# Altium project MIDI Microtonal Keyboard.PrjPcb
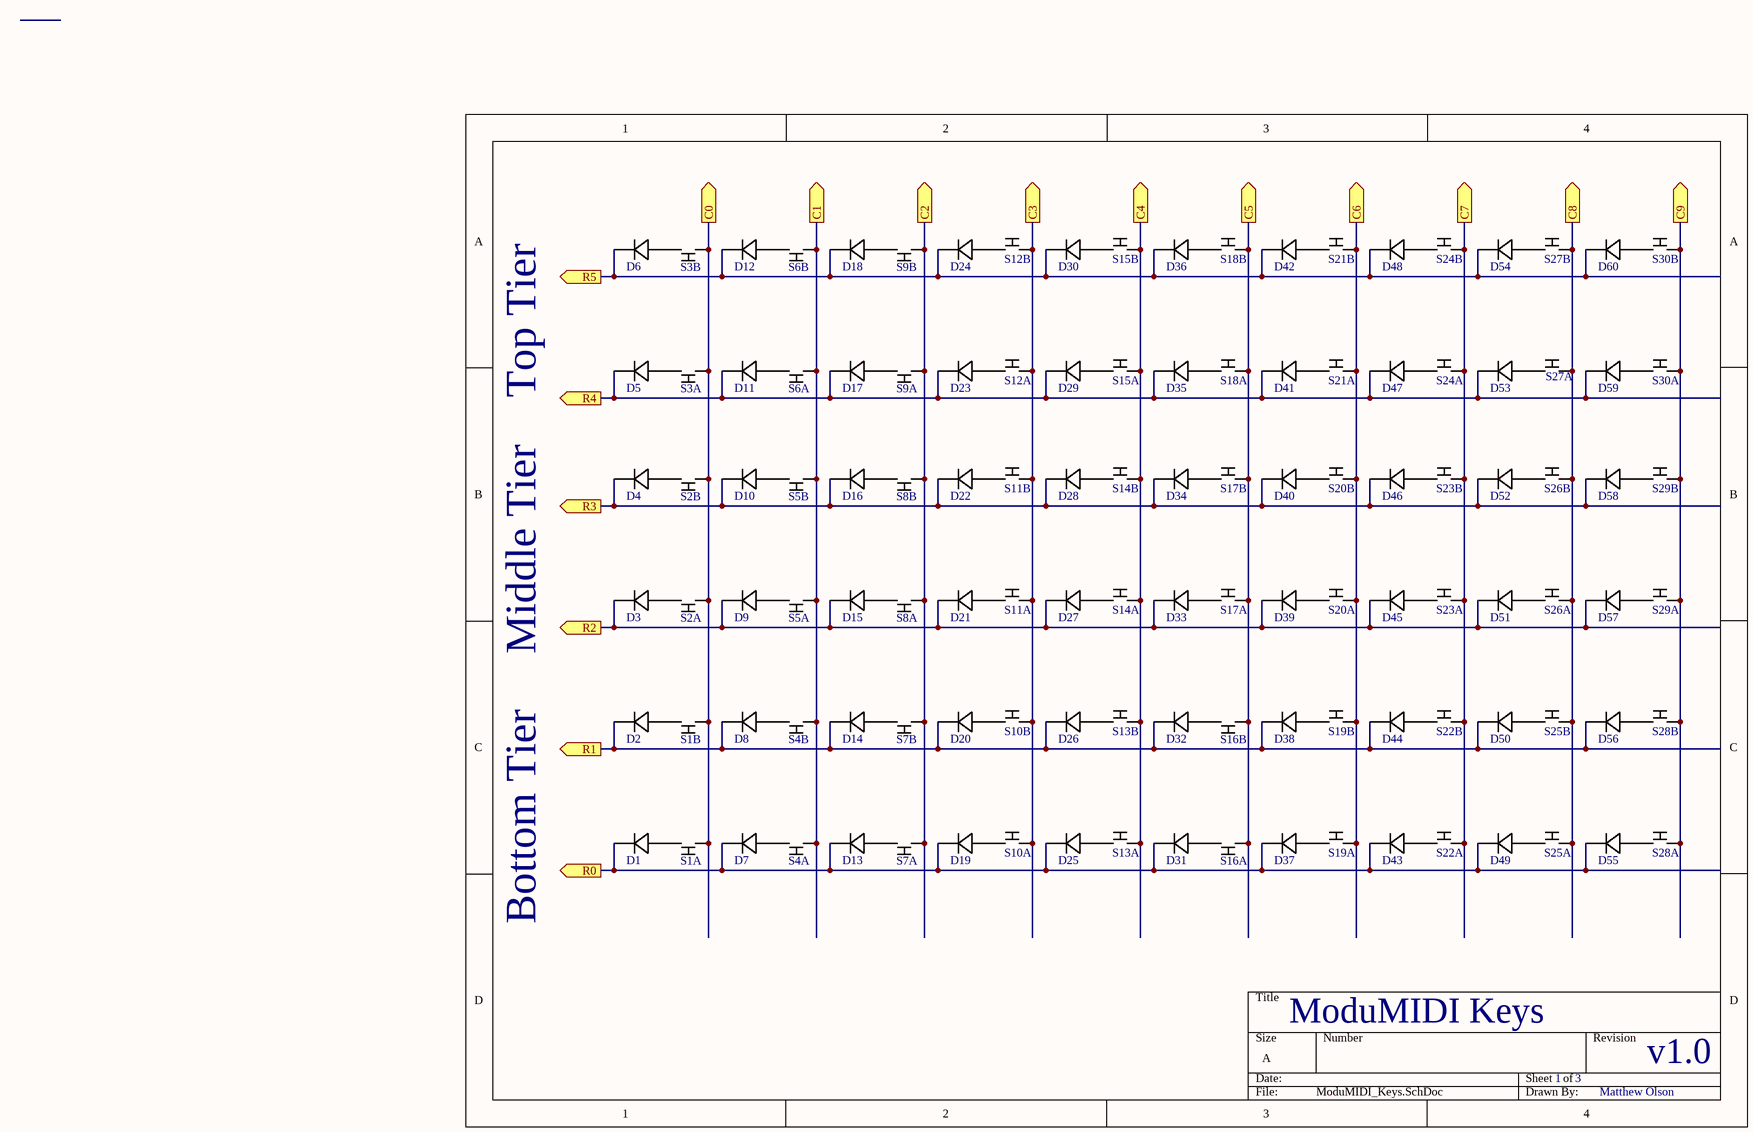
[diagram p0: ModuMIDI_Keys.SchDoc]
=title: ModuMIDI Keys
3 sheets, 162 parts. Net scope: global (net labels, ports and power ports of the same name join across sheets).
Board file: ModuMIDI.PcbDoc
Sheets:
  ModuMIDI_Keys.SchDoc
  ModuMIDI_LEDs.SchDoc
  ModuMIDI_Connectors_GPIO.SchDoc

## Sheet ModuMIDI_Keys.SchDoc
size A; SheetNumber: 1; SheetTotal: 3

### Parts
D1  1N4148-T26A  [DIODE_ZDO_DO-35_ONS]  (value not drawn)
D2  1N4148-T26A  [DIODE_ZDO_DO-35_ONS]  (value not drawn)
D3  1N4148-T26A  [DIODE_ZDO_DO-35_ONS]  (value not drawn)
D4  1N4148-T26A  [DIODE_ZDO_DO-35_ONS]  (value not drawn)
D5  1N4148-T26A  [DIODE_ZDO_DO-35_ONS]  (value not drawn)
D6  1N4148-T26A  [DIODE_ZDO_DO-35_ONS]  (value not drawn)
D7  1N4148-T26A  [DIODE_ZDO_DO-35_ONS]  (value not drawn)
D8  1N4148-T26A  [DIODE_ZDO_DO-35_ONS]  (value not drawn)
D9  1N4148-T26A  [DIODE_ZDO_DO-35_ONS]  (value not drawn)
D10  1N4148-T26A  [DIODE_ZDO_DO-35_ONS]  (value not drawn)
D11  1N4148-T26A  [DIODE_ZDO_DO-35_ONS]  (value not drawn)
D12  1N4148-T26A  [DIODE_ZDO_DO-35_ONS]  (value not drawn)
D13  1N4148-T26A  [DIODE_ZDO_DO-35_ONS]  (value not drawn)
D14  1N4148-T26A  [DIODE_ZDO_DO-35_ONS]  (value not drawn)
D15  1N4148-T26A  [DIODE_ZDO_DO-35_ONS]  (value not drawn)
D16  1N4148-T26A  [DIODE_ZDO_DO-35_ONS]  (value not drawn)
D17  1N4148-T26A  [DIODE_ZDO_DO-35_ONS]  (value not drawn)
D18  1N4148-T26A  [DIODE_ZDO_DO-35_ONS]  (value not drawn)
D19  1N4148-T26A  [DIODE_ZDO_DO-35_ONS]  (value not drawn)
D20  1N4148-T26A  [DIODE_ZDO_DO-35_ONS]  (value not drawn)
D21  1N4148-T26A  [DIODE_ZDO_DO-35_ONS]  (value not drawn)
D22  1N4148-T26A  [DIODE_ZDO_DO-35_ONS]  (value not drawn)
D23  1N4148-T26A  [DIODE_ZDO_DO-35_ONS]  (value not drawn)
D24  1N4148-T26A  [DIODE_ZDO_DO-35_ONS]  (value not drawn)
D25  1N4148-T26A  [DIODE_ZDO_DO-35_ONS]  (value not drawn)
D26  1N4148-T26A  [DIODE_ZDO_DO-35_ONS]  (value not drawn)
D27  1N4148-T26A  [DIODE_ZDO_DO-35_ONS]  (value not drawn)
D28  1N4148-T26A  [DIODE_ZDO_DO-35_ONS]  (value not drawn)
D29  1N4148-T26A  [DIODE_ZDO_DO-35_ONS]  (value not drawn)
D30  1N4148-T26A  [DIODE_ZDO_DO-35_ONS]  (value not drawn)
D31  1N4148-T26A  [DIODE_ZDO_DO-35_ONS]  (value not drawn)
D32  1N4148-T26A  [DIODE_ZDO_DO-35_ONS]  (value not drawn)
D33  1N4148-T26A  [DIODE_ZDO_DO-35_ONS]  (value not drawn)
D34  1N4148-T26A  [DIODE_ZDO_DO-35_ONS]  (value not drawn)
D35  1N4148-T26A  [DIODE_ZDO_DO-35_ONS]  (value not drawn)
D36  1N4148-T26A  [DIODE_ZDO_DO-35_ONS]  (value not drawn)
D37  1N4148-T26A  [DIODE_ZDO_DO-35_ONS]  (value not drawn)
D38  1N4148-T26A  [DIODE_ZDO_DO-35_ONS]  (value not drawn)
D39  1N4148-T26A  [DIODE_ZDO_DO-35_ONS]  (value not drawn)
D40  1N4148-T26A  [DIODE_ZDO_DO-35_ONS]  (value not drawn)
D41  1N4148-T26A  [DIODE_ZDO_DO-35_ONS]  (value not drawn)
D42  1N4148-T26A  [DIODE_ZDO_DO-35_ONS]  (value not drawn)
D43  1N4148-T26A  [DIODE_ZDO_DO-35_ONS]  (value not drawn)
D44  1N4148-T26A  [DIODE_ZDO_DO-35_ONS]  (value not drawn)
D45  1N4148-T26A  [DIODE_ZDO_DO-35_ONS]  (value not drawn)
D46  1N4148-T26A  [DIODE_ZDO_DO-35_ONS]  (value not drawn)
D47  1N4148-T26A  [DIODE_ZDO_DO-35_ONS]  (value not drawn)
D48  1N4148-T26A  [DIODE_ZDO_DO-35_ONS]  (value not drawn)
D49  1N4148-T26A  [DIODE_ZDO_DO-35_ONS]  (value not drawn)
D50  1N4148-T26A  [DIODE_ZDO_DO-35_ONS]  (value not drawn)
D51  1N4148-T26A  [DIODE_ZDO_DO-35_ONS]  (value not drawn)
D52  1N4148-T26A  [DIODE_ZDO_DO-35_ONS]  (value not drawn)
D53  1N4148-T26A  [DIODE_ZDO_DO-35_ONS]  (value not drawn)
D54  1N4148-T26A  [DIODE_ZDO_DO-35_ONS]  (value not drawn)
D55  1N4148-T26A  [DIODE_ZDO_DO-35_ONS]  (value not drawn)
D56  1N4148-T26A  [DIODE_ZDO_DO-35_ONS]  (value not drawn)
D57  1N4148-T26A  [DIODE_ZDO_DO-35_ONS]  (value not drawn)
D58  1N4148-T26A  [DIODE_ZDO_DO-35_ONS]  (value not drawn)
D59  1N4148-T26A  [DIODE_ZDO_DO-35_ONS]  (value not drawn)
D60  1N4148-T26A  [DIODE_ZDO_DO-35_ONS]  (value not drawn)
S1  Button_Symbol  [ModuMIDI_Button_Footprint]  (value not drawn)  (parts A,B of 2)
S2  Button_Symbol  [ModuMIDI_Button_Footprint]  (value not drawn)  (parts A,B of 2)
S3  Button_Symbol  [ModuMIDI_Button_Footprint]  (value not drawn)  (parts A,B of 2)
S4  Button_Symbol  [ModuMIDI_Button_Footprint]  (value not drawn)  (parts A,B of 2)
S5  Button_Symbol  [ModuMIDI_Button_Footprint]  (value not drawn)  (parts A,B of 2)
S6  Button_Symbol  [ModuMIDI_Button_Footprint]  (value not drawn)  (parts A,B of 2)
S7  Button_Symbol  [ModuMIDI_Button_Footprint]  (value not drawn)  (parts A,B of 2)
S8  Button_Symbol  [ModuMIDI_Button_Footprint]  (value not drawn)  (parts A,B of 2)
S9  Button_Symbol  [ModuMIDI_Button_Footprint]  (value not drawn)  (parts A,B of 2)
S10  Button_Symbol  [ModuMIDI_Button_Footprint]  (value not drawn)  (parts A,B of 2)
S11  Button_Symbol  [ModuMIDI_Button_Footprint]  (value not drawn)  (parts A,B of 2)
S12  Button_Symbol  [ModuMIDI_Button_Footprint]  (value not drawn)  (parts A,B of 2)
S13  Button_Symbol  [ModuMIDI_Button_Footprint]  (value not drawn)  (parts A,B of 2)
S14  Button_Symbol  [ModuMIDI_Button_Footprint]  (value not drawn)  (parts A,B of 2)
S15  Button_Symbol  [ModuMIDI_Button_Footprint]  (value not drawn)  (parts A,B of 2)
S16  Button_Symbol  [ModuMIDI_Button_Footprint]  (value not drawn)  (parts A,B of 2)
S17  Button_Symbol  [ModuMIDI_Button_Footprint]  (value not drawn)  (parts A,B of 2)
S18  Button_Symbol  [ModuMIDI_Button_Footprint]  (value not drawn)  (parts A,B of 2)
S19  Button_Symbol  [ModuMIDI_Button_Footprint]  (value not drawn)  (parts A,B of 2)
S20  Button_Symbol  [ModuMIDI_Button_Footprint]  (value not drawn)  (parts A,B of 2)
S21  Button_Symbol  [ModuMIDI_Button_Footprint]  (value not drawn)  (parts A,B of 2)
S22  Button_Symbol  [ModuMIDI_Button_Footprint]  (value not drawn)  (parts A,B of 2)
S23  Button_Symbol  [ModuMIDI_Button_Footprint]  (value not drawn)  (parts A,B of 2)
S24  Button_Symbol  [ModuMIDI_Button_Footprint]  (value not drawn)  (parts A,B of 2)
S25  Button_Symbol  [ModuMIDI_Button_Footprint]  (value not drawn)  (parts A,B of 2)
S26  Button_Symbol  [ModuMIDI_Button_Footprint]  (value not drawn)  (parts A,B of 2)
S27  Button_Symbol  [ModuMIDI_Button_Footprint]  (value not drawn)  (parts A,B of 2)
S28  Button_Symbol  [ModuMIDI_Button_Footprint]  (value not drawn)  (parts A,B of 2)
S29  Button_Symbol  [ModuMIDI_Button_Footprint]  (value not drawn)  (parts A,B of 2)
S30  Button_Symbol  [ModuMIDI_Button_Footprint]  (value not drawn)  (parts A,B of 2)

### Ports
C0 (out), C1 (out), C2 (out), C3 (out), C4 (out), C5 (out), C6 (out), C7 (out), C8 (out), C9 (out), R0 (out), R1 (out), R2 (out), R3 (out), R4 (out), R5 (out)

### Nets
C0: S1.1 S1.3 S2.1 S2.3 S3.1 S3.3 ; port C0
C1: S4.1 S4.3 S5.1 S5.3 S6.1 S6.3 ; port C1
C2: S7.1 S7.3 S8.1 S8.3 S9.1 S9.3 ; port C2
C3: S10.1 S10.3 S11.1 S11.3 S12.1 S12.3 ; port C3
C4: S13.1 S13.3 S14.1 S14.3 S15.1 S15.3 ; port C4
C5: S16.1 S16.3 S17.1 S17.3 S18.1 S18.3 ; port C5
C6: S19.1 S19.3 S20.1 S20.3 S21.1 S21.3 ; port C6
C7: S22.1 S22.3 S23.1 S23.3 S24.1 S24.3 ; port C7
C8: S25.1 S25.3 S26.1 S26.3 S27.1 S27.3 ; port C8
C9: S28.1 S28.3 S29.1 S29.3 S30.1 S30.3 ; port C9
R0: D1.1 D7.1 D13.1 D19.1 D25.1 D31.1 D37.1 D43.1 D49.1 D55.1 ; port R0
R1: D2.1 D8.1 D14.1 D20.1 D26.1 D32.1 D38.1 D44.1 D50.1 D56.1 ; port R1
R2: D3.1 D9.1 D15.1 D21.1 D27.1 D33.1 D39.1 D45.1 D51.1 D57.1 ; port R2
R3: D4.1 D10.1 D16.1 D22.1 D28.1 D34.1 D40.1 D46.1 D52.1 D58.1 ; port R3
R4: D5.1 D11.1 D17.1 D23.1 D29.1 D35.1 D41.1 D47.1 D53.1 D59.1 ; port R4
R5: D6.1 D12.1 D18.1 D24.1 D30.1 D36.1 D42.1 D48.1 D54.1 D60.1 ; port R5
NetD1_2: D1.2 S1.0
NetD2_2: D2.2 S1.2
NetD3_2: D3.2 S2.0
NetD4_2: D4.2 S2.2
NetD5_2: D5.2 S3.0
NetD6_2: D6.2 S3.2
NetD7_2: D7.2 S4.0
NetD8_2: D8.2 S4.2
NetD9_2: D9.2 S5.0
NetD10_2: D10.2 S5.2
NetD11_2: D11.2 S6.0
NetD12_2: D12.2 S6.2
NetD13_2: D13.2 S7.0
NetD14_2: D14.2 S7.2
NetD15_2: D15.2 S8.0
NetD16_2: D16.2 S8.2
NetD17_2: D17.2 S9.0
NetD18_2: D18.2 S9.2
NetD19_2: D19.2 S10.0
NetD20_2: D20.2 S10.2
NetD21_2: D21.2 S11.0
NetD22_2: D22.2 S11.2
NetD23_2: D23.2 S12.0
NetD24_2: D24.2 S12.2
NetD25_2: D25.2 S13.0
NetD26_2: D26.2 S13.2
NetD27_2: D27.2 S14.0
NetD28_2: D28.2 S14.2
NetD29_2: D29.2 S15.0
NetD30_2: D30.2 S15.2
NetD31_2: D31.2 S16.0
NetD32_2: D32.2 S16.2
NetD33_2: D33.2 S17.0
NetD34_2: D34.2 S17.2
NetD35_2: D35.2 S18.0
NetD36_2: D36.2 S18.2
NetD37_2: D37.2 S19.0
NetD38_2: D38.2 S19.2
NetD39_2: D39.2 S20.0
NetD40_2: D40.2 S20.2
NetD41_2: D41.2 S21.0
NetD42_2: D42.2 S21.2
NetD43_2: D43.2 S22.0
NetD44_2: D44.2 S22.2
NetD45_2: D45.2 S23.0
NetD46_2: D46.2 S23.2
NetD47_2: D47.2 S24.0
NetD48_2: D48.2 S24.2
NetD49_2: D49.2 S25.0
NetD50_2: D50.2 S25.2
NetD51_2: D51.2 S26.0
NetD52_2: D52.2 S26.2
NetD53_2: D53.2 S27.0
NetD54_2: D54.2 S27.2
NetD55_2: D55.2 S28.0
NetD56_2: D56.2 S28.2
NetD57_2: D57.2 S29.0
NetD58_2: D58.2 S29.2
NetD59_2: D59.2 S30.0
NetD60_2: D60.2 S30.2

### Notes on the sheet
- Top Tier
- Middle Tier
- Bottom Tier
- ModuMIDI Keys
- 1
- 3
- v1.0
- Matthew Olson

### Library data of the parts
D1-D60 = 1N4148-T26A: DIODE GEN PURP 100V 200MA DO35; Mfr_Name: onsemi; Type: DEV; Copyright: Copyright (C) 2023 Ultra Librarian. All rights reserved.; PN: 1N4148-T26A; RefDes: RefDes
S1-S30 = Button_Symbol: Two button switches to match silicon buttons for keyboard

## Sheet ModuMIDI_LEDs.SchDoc
size A; SheetNumber: 2; SheetTotal: 3
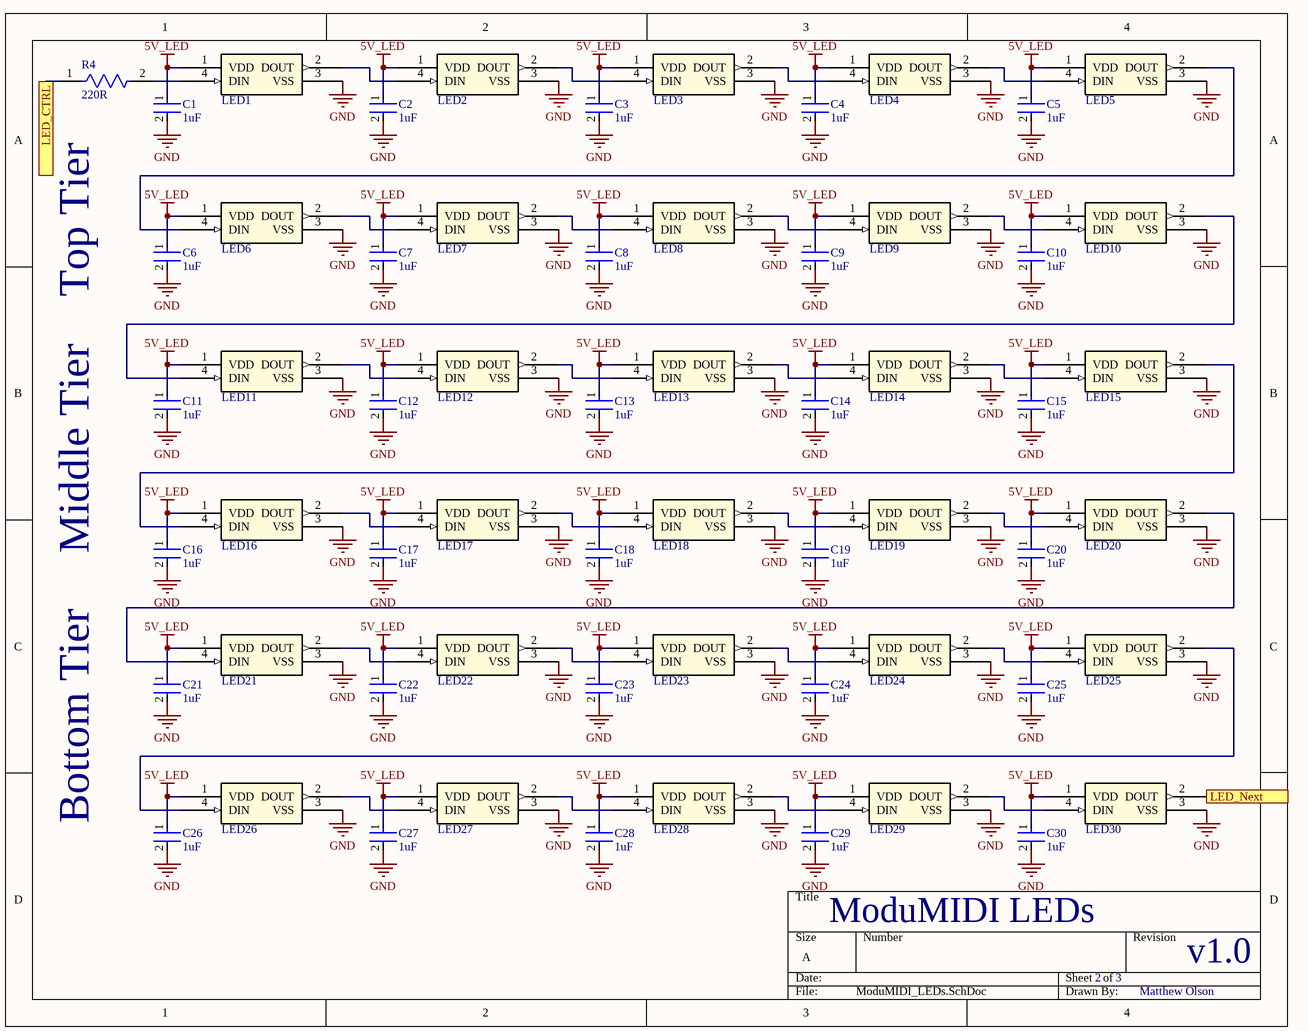
[diagram p1: ModuMIDI_LEDs.SchDoc]

### Parts
C1  1uF  [FP-CC0805-0_85-MFG]
C2  1uF  [FP-CC0805-0_85-MFG]
C3  1uF  [FP-CC0805-0_85-MFG]
C4  1uF  [FP-CC0805-0_85-MFG]
C5  1uF  [FP-CC0805-0_85-MFG]
C6  1uF  [FP-CC0805-0_85-MFG]
C7  1uF  [FP-CC0805-0_85-MFG]
C8  1uF  [FP-CC0805-0_85-MFG]
C9  1uF  [FP-CC0805-0_85-MFG]
C10  1uF  [FP-CC0805-0_85-MFG]
C11  1uF  [FP-CC0805-0_85-MFG]
C12  1uF  [FP-CC0805-0_85-MFG]
C13  1uF  [FP-CC0805-0_85-MFG]
C14  1uF  [FP-CC0805-0_85-MFG]
C15  1uF  [FP-CC0805-0_85-MFG]
C16  1uF  [FP-CC0805-0_85-MFG]
C17  1uF  [FP-CC0805-0_85-MFG]
C18  1uF  [FP-CC0805-0_85-MFG]
C19  1uF  [FP-CC0805-0_85-MFG]
C20  1uF  [FP-CC0805-0_85-MFG]
C21  1uF  [FP-CC0805-0_85-MFG]
C22  1uF  [FP-CC0805-0_85-MFG]
C23  1uF  [FP-CC0805-0_85-MFG]
C24  1uF  [FP-CC0805-0_85-MFG]
C25  1uF  [FP-CC0805-0_85-MFG]
C26  1uF  [FP-CC0805-0_85-MFG]
C27  1uF  [FP-CC0805-0_85-MFG]
C28  1uF  [FP-CC0805-0_85-MFG]
C29  1uF  [FP-CC0805-0_85-MFG]
C30  1uF  [FP-CC0805-0_85-MFG]
LED1  IN-PI55TATPRPGPB  [LED_IN-PI55TAT_INL]  (value not drawn)
LED2  IN-PI55TATPRPGPB  [LED_IN-PI55TAT_INL]  (value not drawn)
LED3  IN-PI55TATPRPGPB  [LED_IN-PI55TAT_INL]  (value not drawn)
LED4  IN-PI55TATPRPGPB  [LED_IN-PI55TAT_INL]  (value not drawn)
LED5  IN-PI55TATPRPGPB  [LED_IN-PI55TAT_INL]  (value not drawn)
LED6  IN-PI55TATPRPGPB  [LED_IN-PI55TAT_INL]  (value not drawn)
LED7  IN-PI55TATPRPGPB  [LED_IN-PI55TAT_INL]  (value not drawn)
LED8  IN-PI55TATPRPGPB  [LED_IN-PI55TAT_INL]  (value not drawn)
LED9  IN-PI55TATPRPGPB  [LED_IN-PI55TAT_INL]  (value not drawn)
LED10  IN-PI55TATPRPGPB  [LED_IN-PI55TAT_INL]  (value not drawn)
LED11  IN-PI55TATPRPGPB  [LED_IN-PI55TAT_INL]  (value not drawn)
LED12  IN-PI55TATPRPGPB  [LED_IN-PI55TAT_INL]  (value not drawn)
LED13  IN-PI55TATPRPGPB  [LED_IN-PI55TAT_INL]  (value not drawn)
LED14  IN-PI55TATPRPGPB  [LED_IN-PI55TAT_INL]  (value not drawn)
LED15  IN-PI55TATPRPGPB  [LED_IN-PI55TAT_INL]  (value not drawn)
LED16  IN-PI55TATPRPGPB  [LED_IN-PI55TAT_INL]  (value not drawn)
LED17  IN-PI55TATPRPGPB  [LED_IN-PI55TAT_INL]  (value not drawn)
LED18  IN-PI55TATPRPGPB  [LED_IN-PI55TAT_INL]  (value not drawn)
LED19  IN-PI55TATPRPGPB  [LED_IN-PI55TAT_INL]  (value not drawn)
LED20  IN-PI55TATPRPGPB  [LED_IN-PI55TAT_INL]  (value not drawn)
LED21  IN-PI55TATPRPGPB  [LED_IN-PI55TAT_INL]  (value not drawn)
LED22  IN-PI55TATPRPGPB  [LED_IN-PI55TAT_INL]  (value not drawn)
LED23  IN-PI55TATPRPGPB  [LED_IN-PI55TAT_INL]  (value not drawn)
LED24  IN-PI55TATPRPGPB  [LED_IN-PI55TAT_INL]  (value not drawn)
LED25  IN-PI55TATPRPGPB  [LED_IN-PI55TAT_INL]  (value not drawn)
LED26  IN-PI55TATPRPGPB  [LED_IN-PI55TAT_INL]  (value not drawn)
LED27  IN-PI55TATPRPGPB  [LED_IN-PI55TAT_INL]  (value not drawn)
LED28  IN-PI55TATPRPGPB  [LED_IN-PI55TAT_INL]  (value not drawn)
LED29  IN-PI55TATPRPGPB  [LED_IN-PI55TAT_INL]  (value not drawn)
LED30  IN-PI55TATPRPGPB  [LED_IN-PI55TAT_INL]  (value not drawn)
R4  220R  [FP-CRCW0805-e3-MFG]

### Ports
LED_CTRL, LED_Next (out)

### Nets
5V_LED: C1.1 C2.1 C3.1 C4.1 C5.1 C6.1 C7.1 C8.1 C9.1 C10.1 C11.1 C12.1 C13.1 C14.1 C15.1 C16.1 C17.1 C18.1 C19.1 C20.1 C21.1 C22.1 C23.1 C24.1 C25.1 C26.1 C27.1 C28.1 C29.1 C30.1 LED1.1(VDD) LED2.1(VDD) LED3.1(VDD) LED4.1(VDD) LED5.1(VDD) LED6.1(VDD) LED7.1(VDD) LED8.1(VDD) LED9.1(VDD) LED10.1(VDD) LED11.1(VDD) LED12.1(VDD) LED13.1(VDD) LED14.1(VDD) LED15.1(VDD) LED16.1(VDD) LED17.1(VDD) LED18.1(VDD) LED19.1(VDD) LED20.1(VDD) LED21.1(VDD) LED22.1(VDD) LED23.1(VDD) LED24.1(VDD) LED25.1(VDD) LED26.1(VDD) LED27.1(VDD) LED28.1(VDD) LED29.1(VDD) LED30.1(VDD)
GND: C1.2 C2.2 C3.2 C4.2 C5.2 C6.2 C7.2 C8.2 C9.2 C10.2 C11.2 C12.2 C13.2 C14.2 C15.2 C16.2 C17.2 C18.2 C19.2 C20.2 C21.2 C22.2 C23.2 C24.2 C25.2 C26.2 C27.2 C28.2 C29.2 C30.2 LED1.3(VSS) LED2.3(VSS) LED3.3(VSS) LED4.3(VSS) LED5.3(VSS) LED6.3(VSS) LED7.3(VSS) LED8.3(VSS) LED9.3(VSS) LED10.3(VSS) LED11.3(VSS) LED12.3(VSS) LED13.3(VSS) LED14.3(VSS) LED15.3(VSS) LED16.3(VSS) LED17.3(VSS) LED18.3(VSS) LED19.3(VSS) LED20.3(VSS) LED21.3(VSS) LED22.3(VSS) LED23.3(VSS) LED24.3(VSS) LED25.3(VSS) LED26.3(VSS) LED27.3(VSS) LED28.3(VSS) LED29.3(VSS) LED30.3(VSS)
LED_CTRL: R4.1 ; port LED_CTRL
LED_Next: LED30.2(DOUT) ; port LED_Next
NetLED1_2: LED1.2(DOUT) LED2.4(DIN)
NetLED1_4: LED1.4(DIN) R4.2
NetLED2_2: LED2.2(DOUT) LED3.4(DIN)
NetLED3_2: LED3.2(DOUT) LED4.4(DIN)
NetLED4_2: LED4.2(DOUT) LED5.4(DIN)
NetLED5_2: LED5.2(DOUT) LED6.4(DIN)
NetLED6_2: LED6.2(DOUT) LED7.4(DIN)
NetLED7_2: LED7.2(DOUT) LED8.4(DIN)
NetLED8_2: LED8.2(DOUT) LED9.4(DIN)
NetLED9_2: LED9.2(DOUT) LED10.4(DIN)
NetLED10_2: LED10.2(DOUT) LED11.4(DIN)
NetLED11_2: LED11.2(DOUT) LED12.4(DIN)
NetLED12_2: LED12.2(DOUT) LED13.4(DIN)
NetLED13_2: LED13.2(DOUT) LED14.4(DIN)
NetLED14_2: LED14.2(DOUT) LED15.4(DIN)
NetLED15_2: LED15.2(DOUT) LED16.4(DIN)
NetLED16_2: LED16.2(DOUT) LED17.4(DIN)
NetLED17_2: LED17.2(DOUT) LED18.4(DIN)
NetLED18_2: LED18.2(DOUT) LED19.4(DIN)
NetLED19_2: LED19.2(DOUT) LED20.4(DIN)
NetLED20_2: LED20.2(DOUT) LED21.4(DIN)
NetLED21_2: LED21.2(DOUT) LED22.4(DIN)
NetLED22_2: LED22.2(DOUT) LED23.4(DIN)
NetLED23_2: LED23.2(DOUT) LED24.4(DIN)
NetLED24_2: LED24.2(DOUT) LED25.4(DIN)
NetLED25_2: LED25.2(DOUT) LED26.4(DIN)
NetLED26_2: LED26.2(DOUT) LED27.4(DIN)
NetLED27_2: LED27.2(DOUT) LED28.4(DIN)
NetLED28_2: LED28.2(DOUT) LED29.4(DIN)
NetLED29_2: LED29.2(DOUT) LED30.4(DIN)

### Notes on the sheet
- (near R4) Top Tier
- Middle Tier
- Bottom Tier
- ModuMIDI LEDs
- 2
- 3
- v1.0
- Matthew Olson

### Library data of the parts
C1-C30 = CMP-03422-000182-1: CAP CER 1UF 10V X7R 0805; Manufacturer: Yageo; Manufacturer Part Number: CC0805KKX7R6BB105; Material: Ceramic; Tolerance: 0.1; Value: 1 uF; ComponentLink2URL: http://www.yageo.com/documents/recent/UPY-GPHC_Y5V_6.3V-to-50V_8.pdf; Automotive: No; Temperature Range Low: -30°C; Octopart: https://octopart.com/cc0805kkx7r6bb105-yageo-42522859; Temperature Characteristic: X7R; RoHS: TRUE; Voltage Rating: 10 V; Capacitance: 1 uF; Package: CC0805-0.85; Device Class L3: Ceramic Capacitors; Category: Cap; Mouser Description: Multilayer Ceramic Capacitors MLCC - SMD/SMT 1.0uF 10V X7R 10%; Temperature Range High: +85°C; Ipc Land Pattern Name: CAPC200125X85; ComponentLink2Description: Datasheet; Temperature: -30°C to +85°C; Height: 0.95mm; Lead Free: Yes; Device Class L1: Passive Components; Device Class L2: Capacitors; Footprint Url: http://www.yageo.com/exep/pages/download/literatures/UPY-C_GEN_24.pdf; Digikey Description: CAP CER 1UF 10V X7R 0805; PN: CC0805KKX7R6BB105
LED1-LED30 = IN-PI55TATPRPGPB: No Description Available; Mfr_Name: Inolux; RefDes: RefDes; Type: Type; PN: IN-PI55TATPRPGPB
R4 = CMP-2001-03682-2: RES Thick Film, 220Ω, 1%, 0.125W, 100ppm/°C, 0805; Max Power Dissipation: 125mW; Voltage Rating: 150V; PN: CRCW0805220RFKEA; Packaging: Tape and Reel; Termination: SMD/SMT; Height: 0.45mm; Package Quantity: 10; Width: 0.049inch; Min Operating Temperature: -55°C; Lead Free: Lead Free; Military Standard: Not; Mount: Surface Mount; Max Operating Temperature: 155°C; Voltage Rating (DC): 150V; Resistance: 220R; Composition: Thick Film; Case/Package: 0805; Length: 2mm; Weight: 0.000194oz; Case Code (Metric): 2012; Number of Terminations: 2; Case Code (Imperial): 0805; Radiation Hardening: No; Tolerance: 1%; Features: Automotive AEC-Q200; Power Rating: 125mW; Depth: 1.25mm; Contact Plating: Tin; Temperature Coefficient: 100ppm/°C

## Sheet ModuMIDI_Connectors_GPIO.SchDoc
size A; SheetNumber: 3; SheetTotal: 3
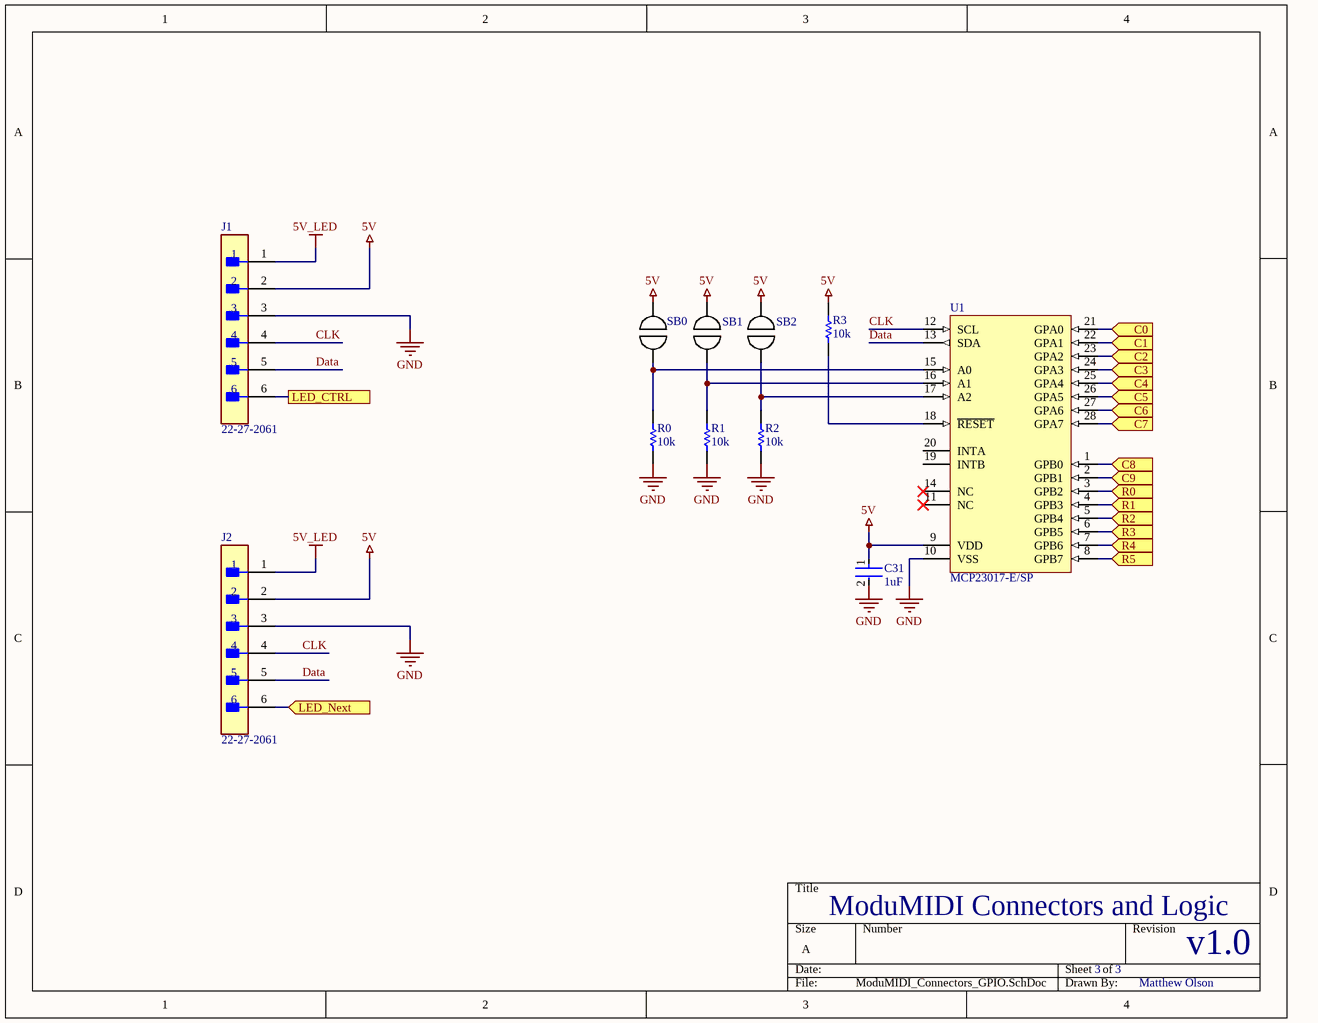
[diagram p2: ModuMIDI_Connectors_GPIO.SchDoc]

### Parts
C31  1uF  [FP-CC0805-0_85-MFG]
J1  22-27-2061  [FP-22-27-2061-MFG]
J2  22-27-2061  [FP-22-27-2061-MFG]
R0  10k  [RESC2013X60X35NL10T20]
R1  10k  [RESC2013X60X35NL10T20]
R2  10k  [RESC2013X60X35NL10T20]
R3  10k  [RESC2013X60X35NL10T20]
SB0  Solder_Bridge_Open  [PCBComponent_1]  (value not drawn)  (net tie, no BOM)
SB1  Solder_Bridge_Open  [PCBComponent_1]  (value not drawn)  (net tie, no BOM)
SB2  Solder_Bridge_Open  [PCBComponent_1]  (value not drawn)  (net tie, no BOM)
U1  MCP23017-E/SP  [SPDIP300-SP28]

### Ports
C0 (in), C1 (in), C2 (in), C3 (in), C4 (in), C5 (in), C6 (in), C7 (in), C8 (in), C9 (in), LED_CTRL, LED_Next (in), R0 (in), R1 (in), R2 (in), R3 (in), R4 (in), R5 (in)

### Nets
5V: C31.1 J1.2 J2.2 R3.2 SB0.2 SB1.2 SB2.2 U1.9(VDD)
5V_LED: J1.1 J2.1
GND: C31.2 J1.3 J2.3 R0.1 R1.1 R2.1 U1.10(VSS)
C0: U1.21(GPA0) ; port C0
C1: U1.22(GPA1) ; port C1
C2: U1.23(GPA2) ; port C2
C3: U1.24(GPA3) ; port C3
C4: U1.25(GPA4) ; port C4
C5: U1.26(GPA5) ; port C5
C6: U1.27(GPA6) ; port C6
C7: U1.28(GPA7) ; port C7
C8: U1.1(GPB0) ; port C8
C9: U1.2(GPB1) ; port C9
CLK: J1.4 J2.4 U1.12(SCL)
Data: J1.5 J2.5 U1.13(SDA)
LED_CTRL: J1.6 ; port LED_CTRL
LED_Next: J2.6 ; port LED_Next
R0: U1.3(GPB2) ; port R0
R1: U1.4(GPB3) ; port R1
R2: U1.5(GPB4) ; port R2
R3: U1.6(GPB5) ; port R3
R4: U1.7(GPB6) ; port R4
R5: U1.8(GPB7) ; port R5
NetR0_2: R0.2 SB0.1 U1.15(A0)
NetR1_2: R1.2 SB1.1 U1.16(A1)
NetR2_2: R2.2 SB2.1 U1.17(A2)
NetR3_1: R3.1 U1.18(~{RESET})

Not connected (* = marked no-connect by the designer): U1 11(NC)* 14(NC)* 19(INTB) 20(INTA)

### Notes on the sheet
- ModuMIDI Connectors and Logic
- 3
- v1.0
- Matthew Olson

### Library data of the parts
C31 = CMP-03422-000182-1: as C1 on sheet ModuMIDI_LEDs; Value: 1 uF; ComponentLink2URL: http://www.yageo.com/documents/recent/UPY-GPHC_Y5V_6.3V-to-50V_8.pdf; Automotive: No; Temperature Range Low: -30°C; Octopart: https://octopart.com/cc0805kkx7r6bb105-yageo-42522859; Temperature Characteristic: X7R; RoHS: TRUE; Voltage Rating: 10 V; Capacitance: 1 uF; Package: CC0805-0.85; Device Class L3: Ceramic Capacitors; Category: Cap; Mouser Description: Multilayer Ceramic Capacitors MLCC - SMD/SMT 1.0uF 10V X7R 10%; Temperature Range High: +85°C; Ipc Land Pattern Name: CAPC200125X85; ComponentLink2Description: Datasheet; Temperature: -30°C to +85°C; Height: 0.95mm; Lead Free: Yes; Device Class L1: Passive Components; Device Class L2: Capacitors; Footprint Url: http://www.yageo.com/exep/pages/download/literatures/UPY-C_GEN_24.pdf; Digikey Description: CAP CER 1UF 10V X7R 0805; PN: CC0805KKX7R6BB105
J1 J2 = CMP-04776-000309-1: CONN HEADER VERT 6POS 2.54MM; Number of Contacts: 6; Current Rating: 4A; Voltage Rating (AC): 250V; Contact Resistance: 10mR; Hole Diameter: 1.02mm; Connector Type: Male Pin; Gender: Male; Mount: Through Hole; REACH SVHC: No SVHC; Number of Rows: 1; Contact Plating: Tin; Series: KK; Depth: 5.8mm; Flammability Rating: UL94 V-0; Contact Type: Male Pin; Lead Pitch: 2.54mm; Min Operating Temperature: 0°C; Pitch: 2.54mm; Radiation Hardening: No; Color: Natural; Length: 15.24mm; Termination: Solder; Orientation: Straight; Contact Material: Brass; Max Voltage Rating (AC): 250V; Housing Material: Nylon; Max Operating Temperature: 75°C; Working Voltage: 250V; Max Current Rating: 4A; Fastening Type: Friction; Voltage Rating: 250V; Housing Color: White; Packaging: Bulk; Material: Nylon; Contact Mating Length: 0.295inch; Package Quantity: 10000; Number of Positions: 6
R0-R3 = CMP-1659-00013-4: Chip Resistor, 10 KOhm, +/- 1%, 0.125 W, -55 to 155 degC, 0805 (2012 Metric), RoHS, Tape and Reel / RC0805FR-0710KL; Manufacturer: Yageo; Voltage Rating: 150 V; Mount: Surface Mount; ComponentLink1Description: Manufacturer URL; ComponentLink2URL: http://www.yageo.com/documents/recent/PYu-RC_Group_51_RoHS_L_04.pdf; Pins: 2; Length: 2 mm; Min Operating Temperature: -55 degC; Height: 0.5 mm; Mounting Technology: Surface Mount; RoHSCompliant: true; REACH SVHC: No SVHC; ComponentLink1URL: http://www.yageo.com/; Max Operating Temperature: 155 degC; PackageReference: 0805; DatasheetVersion: Rev. 4, 02/2016; Package Quantity: 5000; Packaging: Tape and Reel; ComponentLink2Description: Datasheet; PackageDescription: 2-Pin Surface Mounted Device, Body 2 x 1.25 mm; PN: RC0805FR-0710KL
SB0-SB2 = Solder_Bridge_Open: Normally open solder bridge
U1 = CMP-0186-00081-2: 16-Bit I/O Expander with Serial Interface, 28-Pin SPDIP, Extended Temperature; RevisionNote: URLs added.; ComponentLink3Description: Package Specification; PackageVersion: revBB, Aug-2009; ComponentLink1Description: Manufacturer URL; DatasheetVersion: revB, Feb-2007; PackageDescription: 28-Lead Skinny Plastic Dual In-Line (SP) - 300 mil Body [SPDIP]; ComponentLink1URL: http://www.microchip.com/; PackageReference: SPDIP300-SP28; ComponentLink3URL: http://www.microchip.com/stellent/groups/techpub_sg/documents/packagingspec/en012702.pdf; ComponentLink2Description: Datasheet; ComponentLink2URL: http://ww1.microchip.com/downloads/en/DeviceDoc/21952b.pdf

## Nets that join several sheets
5V_LED: ModuMIDI_LEDs (60 pins), ModuMIDI_Connectors_GPIO (J1.1 J2.1)
GND: ModuMIDI_LEDs (60 pins), ModuMIDI_Connectors_GPIO (7 pins)
C0: ModuMIDI_Keys (6 pins), ModuMIDI_Connectors_GPIO (U1.21)
C1: ModuMIDI_Keys (6 pins), ModuMIDI_Connectors_GPIO (U1.22)
C2: ModuMIDI_Keys (6 pins), ModuMIDI_Connectors_GPIO (U1.23)
C3: ModuMIDI_Keys (6 pins), ModuMIDI_Connectors_GPIO (U1.24)
C4: ModuMIDI_Keys (6 pins), ModuMIDI_Connectors_GPIO (U1.25)
C5: ModuMIDI_Keys (6 pins), ModuMIDI_Connectors_GPIO (U1.26)
C6: ModuMIDI_Keys (6 pins), ModuMIDI_Connectors_GPIO (U1.27)
C7: ModuMIDI_Keys (6 pins), ModuMIDI_Connectors_GPIO (U1.28)
C8: ModuMIDI_Keys (6 pins), ModuMIDI_Connectors_GPIO (U1.1)
C9: ModuMIDI_Keys (6 pins), ModuMIDI_Connectors_GPIO (U1.2)
LED_CTRL: ModuMIDI_LEDs (R4.1), ModuMIDI_Connectors_GPIO (J1.6)
LED_Next: ModuMIDI_LEDs (LED30.2), ModuMIDI_Connectors_GPIO (J2.6)
R0: ModuMIDI_Keys (10 pins), ModuMIDI_Connectors_GPIO (U1.3)
R1: ModuMIDI_Keys (10 pins), ModuMIDI_Connectors_GPIO (U1.4)
R2: ModuMIDI_Keys (10 pins), ModuMIDI_Connectors_GPIO (U1.5)
R3: ModuMIDI_Keys (10 pins), ModuMIDI_Connectors_GPIO (U1.6)
R4: ModuMIDI_Keys (10 pins), ModuMIDI_Connectors_GPIO (U1.7)
R5: ModuMIDI_Keys (10 pins), ModuMIDI_Connectors_GPIO (U1.8)